# Altium project FRED_MIERING.PrjPCB (part 1 of 2)
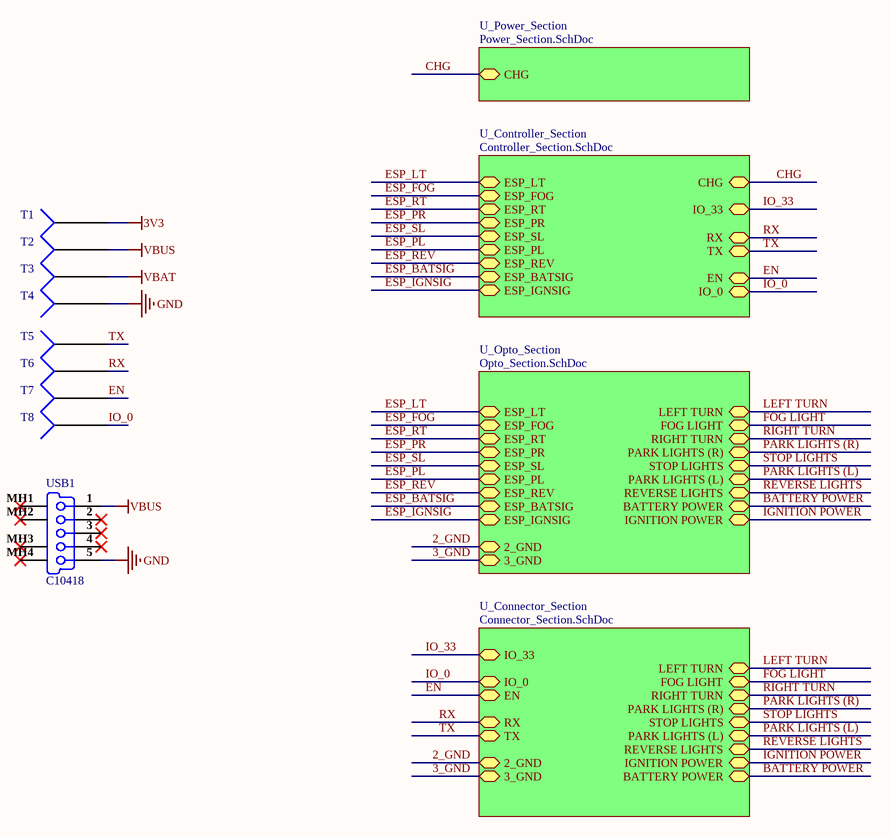
[diagram p0: Top_Sheet.SchDoc]
5 sheets, 105 parts. Net scope: hierarchical (ports join the sheet entries above them; power ports are global).
Board file: Fred_ New.PcbDoc
Sheets:
  Top_Sheet.SchDoc
    U_Power_Section = Power_Section.SchDoc
    U_Controller_Section = Controller_Section.SchDoc
    U_Opto_Section = Opto_Section.SchDoc
    U_Connector_Section = Connector_Section.SchDoc

## Sheet Top_Sheet.SchDoc
size A4; DocumentNumber: 1; SheetNumber: 1; SheetTotal: 5

### Parts
T1  Socket  [Socket]  (value not drawn)
T2  Socket  [Socket]  (value not drawn)
T3  Socket  [Socket]  (value not drawn)
T4  Socket  [Socket]  (value not drawn)
T5  Socket  [Socket]  (value not drawn)
T6  Socket  [Socket]  (value not drawn)
T7  Socket  [Socket]  (value not drawn)
T8  Socket  [Socket]  (value not drawn)
USB1  C10418  [C10418]

### Sub-sheets
U_Connector_Section = Connector_Section.SchDoc: IO_33 (bidir), RX (bidir), TX (bidir), IO_0 (bidir), EN (bidir), 3_GND (bidir), 2_GND (bidir), BATTERY POWER (bidir), REVERSE LIGHTS (bidir), IGNITION POWER (bidir), PARK LIGHTS (L) (bidir), STOP LIGHTS (bidir), PARK LIGHTS (R) (bidir), RIGHT TURN (bidir), FOG LIGHT (bidir), LEFT TURN (bidir)
U_Controller_Section = Controller_Section.SchDoc: CHG (bidir), IO_33 (bidir), RX (bidir), TX (bidir), EN (bidir), IO_0 (bidir), ESP_REV (bidir), ESP_PL (bidir), ESP_BATSIG (bidir), ESP_SL (bidir), ESP_PR (bidir), ESP_RT (bidir), ESP_IGNSIG (bidir), ESP_FOG (bidir), ESP_LT (bidir)
U_Opto_Section = Opto_Section.SchDoc: 3_GND (bidir), 2_GND (bidir), LEFT TURN (bidir), PARK LIGHTS (L) (bidir), REVERSE LIGHTS (bidir), STOP LIGHTS (bidir), BATTERY POWER (bidir), IGNITION POWER (bidir), PARK LIGHTS (R) (bidir), FOG LIGHT (bidir), RIGHT TURN (bidir), ESP_PL (bidir), ESP_LT (bidir), ESP_RT (bidir), ESP_BATSIG (bidir), ESP_SL (bidir), ESP_REV (bidir), ESP_IGNSIG (bidir), ESP_FOG (bidir), ESP_PR (bidir)
U_Power_Section = Power_Section.SchDoc: CHG (bidir)

### Nets
3V3: T1.1
GND: T4.1 USB1.5(GND)
VBAT: T3.1
VBUS: T2.1 USB1.1(V_BUS_(5V))
2_GND: sheet U_Opto_Section/2_GND, sheet U_Connector_Section/2_GND
3_GND: sheet U_Opto_Section/3_GND, sheet U_Connector_Section/3_GND
BATTERY POWER: sheet U_Opto_Section/BATTERY POWER, sheet U_Connector_Section/BATTERY POWER
CHG: sheet U_Power_Section/CHG, sheet U_Controller_Section/CHG
EN: T7.1 ; sheet U_Controller_Section/EN, sheet U_Connector_Section/EN
ESP_BATSIG: sheet U_Controller_Section/ESP_BATSIG, sheet U_Opto_Section/ESP_BATSIG
ESP_FOG: sheet U_Controller_Section/ESP_FOG, sheet U_Opto_Section/ESP_FOG
ESP_IGNSIG: sheet U_Controller_Section/ESP_IGNSIG, sheet U_Opto_Section/ESP_IGNSIG
ESP_LT: sheet U_Controller_Section/ESP_LT, sheet U_Opto_Section/ESP_LT
ESP_PL: sheet U_Controller_Section/ESP_PL, sheet U_Opto_Section/ESP_PL
ESP_PR: sheet U_Controller_Section/ESP_PR, sheet U_Opto_Section/ESP_PR
ESP_REV: sheet U_Controller_Section/ESP_REV, sheet U_Opto_Section/ESP_REV
ESP_RT: sheet U_Controller_Section/ESP_RT, sheet U_Opto_Section/ESP_RT
ESP_SL: sheet U_Controller_Section/ESP_SL, sheet U_Opto_Section/ESP_SL
FOG LIGHT: sheet U_Opto_Section/FOG LIGHT, sheet U_Connector_Section/FOG LIGHT
IGNITION POWER: sheet U_Opto_Section/IGNITION POWER, sheet U_Connector_Section/IGNITION POWER
IO_0: T8.1 ; sheet U_Controller_Section/IO_0, sheet U_Connector_Section/IO_0
IO_33: sheet U_Controller_Section/IO_33, sheet U_Connector_Section/IO_33
LEFT TURN: sheet U_Opto_Section/LEFT TURN, sheet U_Connector_Section/LEFT TURN
PARK LIGHTS (L): sheet U_Opto_Section/PARK LIGHTS (L), sheet U_Connector_Section/PARK LIGHTS (L)
PARK LIGHTS (R): sheet U_Opto_Section/PARK LIGHTS (R), sheet U_Connector_Section/PARK LIGHTS (R)
REVERSE LIGHTS: sheet U_Opto_Section/REVERSE LIGHTS, sheet U_Connector_Section/REVERSE LIGHTS
RIGHT TURN: sheet U_Opto_Section/RIGHT TURN, sheet U_Connector_Section/RIGHT TURN
RX: T6.1 ; sheet U_Controller_Section/RX, sheet U_Connector_Section/RX
STOP LIGHTS: sheet U_Opto_Section/STOP LIGHTS, sheet U_Connector_Section/STOP LIGHTS
TX: T5.1 ; sheet U_Controller_Section/TX, sheet U_Connector_Section/TX

Not connected (* = marked no-connect by the designer): USB1 2(D-)* 3(D+)* 4(NC)* MH1(Tab)* MH2(Tab)* MH3(Tab)* MH4(Tab)*

### Library data of the parts
USB1 = C10418: USB - Micro B Female USB 2 5 SMD USB Connectors RoHS; Manufacturer: Jing Extension of the Electronic Co.; Gender: Receptacle; Connector Type: USB,Receptacle; Number of Contacts: 5; Number of Ports: 1; Manufacturer Part Number: C10418; Mount: Surface Mount,Horizontal; Number of Terminals: 5; Termination: Solder; Orientation: Right Angle; ComponentLink1URL: http://www.amphenol-icc.com/media/wysiwyg/files/drawing/10118194.pdf?src-supplier=Digi-Key; ComponentLink1Description: http://www.amphenol-icc.com/media/wysiwyg/files/drawing/10118194.pdf?src-supplier=Digi-Key; ComponentLink2URL: https://cdn.amphenol-icc.com/media/wysiwyg/files/drawing/10118194.pdf?src-supplier=Mouser; ComponentLink2Description: https://cdn.amphenol-icc.com/media/wysiwyg/files/drawing/10118194.pdf?src-supplier=Mouser; ComponentLink3URL: https://cdn.amphenol-icc.com/media/wysiwyg/files/drawing/10118194.pdf?src-supplier=Verical; ComponentLink3Description: https://cdn.amphenol-icc.com/media/wysiwyg/files/drawing/10118194.pdf?src-supplier=Verical; Link: https://lcsc.com/product-detail/USB-Connectors_Jing-Extension-of-the-Electronic-Co-C10418_C10418.html
T1-T8 = Socket: LatestRevisionDate: 17-Jul-2002; LatestRevisionNote: Re-released for DXP Platform.; Publisher: Altium Limited

## Sheet Power_Section.SchDoc: Power Section
size A4; Engineer: Electron Ali; DocumentNumber: 2; SheetNumber: 2; SheetTotal: 5
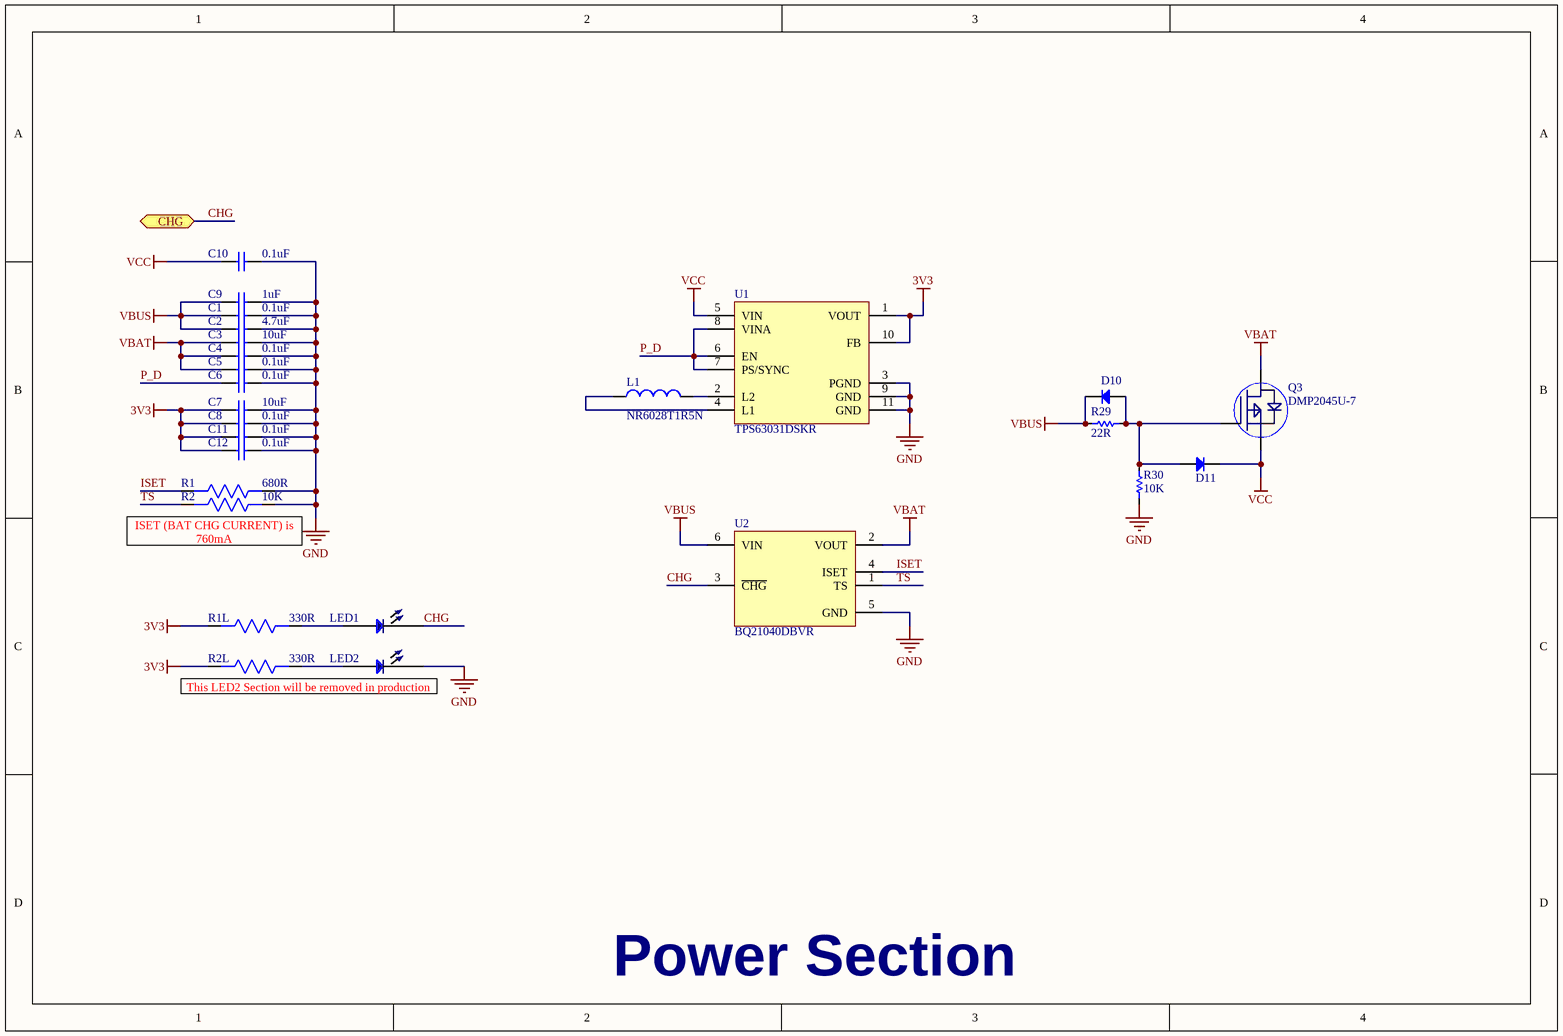
[diagram p1: Power_Section.SchDoc]

### Parts
C1  0.1uF  [Cap0603]
C2  4.7uF  [Cap0603]
C3  10uF  [Cap0603]
C4  0.1uF  [Cap0603]
C5  0.1uF  [Cap0603]
C6  0.1uF  [Cap0603]
C7  10uF  [Cap0603]
C8  0.1uF  [Cap0603]
C9  1uF  [Cap0603]
C10  0.1uF  [Cap0603]
C11  0.1uF  [Cap0603]
C12  0.1uF  [Cap0603]
D10  1N4148W-7-F  [SOD-123]  (value not drawn)
D11  1N4148W-7-F  [SOD-123]  (value not drawn)
L1  NR6028T1R5N  [NR6028T1R5N]
LED1  APT1608QBC/D  [LED 0603]  (value not drawn)
LED2  APT1608QBC/D  [LED 0603]  (value not drawn)
Q3  DMP2045U-7  [SOT23-3]
R1  680R  [Res0603]
R1L  330R  [Res0603]
R2  10K  [Res0603]
R2L  330R  [Res0603]
R29  22R  [Res-0603]
R30  10K  [Res-0603]
U1  TPS63031DSKR  [TPS63031DSKR]
U2  BQ21040DBVR  [BQ21040DBVR]

### Ports
CHG (bidir)

### Nets
3V3: C7.1 C8.1 C11.1 C12.1 R1L.2 R2L.2 U1.1(VOUT) U1.10(FB)
GND: C1.2 C2.2 C3.2 C4.2 C5.2 C6.2 C7.2 C8.2 C9.2 C10.2 C11.2 C12.2 LED2.2 R1.1 R2.1 R30.1 U1.3(PGND) U1.9(GND) U1.11(GND) U2.5(GND)
VBAT: C3.1 C4.1 C5.1 Q3.3(D) U2.2(VOUT)
VBUS: C1.1 C2.1 C9.1 D10.2(K) R29.1 U2.6(VIN)
VCC: C10.1 D11.2(K) Q3.2(S) U1.5(VIN)
CHG: LED1.2 U2.3(~{CHG}) ; port CHG
ISET: R1.2 U2.4(ISET)
P_D: C6.1 U1.6(EN) U1.7(PS/SYNC) U1.8(VINA)
TS: R2.2 U2.1(TS)
NetD10_1: D10.1(A) D11.1(A) Q3.1(G) R29.2 R30.2
NetL1_1: L1.1 U1.4(L1)
NetL1_2: L1.2 U1.2(L2)
NetLED1_1: LED1.1 R1L.1
NetLED2_1: LED2.1 R2L.1

### Notes on the sheet
- (near R2) ISET (BAT CHG CURRENT) is 760mA
- This LED2 Section will be removed in production
- Power Section

### Library data of the parts
C1 C4-C6 C8 C10-C12 = CC0603ZRY5V9BB104: CAP CER 0.1UF 50V Y5V 0603; Manufacturer: Yageo; Capacitance: 100nF; Tolerance: 80%; Supplier 1: Digi-Key; Manufacturer Part Number: CC0603ZRY5V9BB104; Stock 1: 15000880; Pricing 1: 1=0.1, 10=0.075, 100=0.0334, 500=0.02386, 1000=0.01874 (USD); Mount: Surface Mount; Case/Package: 0603; Number of Pins: 2; Case Code (Metric): 1608; Case Code (Imperial): 0603; Min Operating Temperature: -30°C; Max Operating Temperature: 85°C; Dielectric: Y5V; Voltage Rating: 50V; Package Quantity: 1; Packaging: Tape and Reel; Voltage Rating (DC): 50V; Termination: SMD/SMT; Composition: Ceramic; Voltage: 50V; Length: 1.6mm; Height: 0.8mm; Width: 0.031inch; Thickness: 0.035inch; Depth: 0.8mm; Radiation Hardening: No; REACH SVHC: No SVHC; Lead Free: Lead Free; Halogen Free: Halogen Free; ComponentLink1URL: http://www.yageo.com/documents/recent/UPY-GPHC_Y5V_6.3V-to-50V_8.pdf?src-supplier=Digi-Key; ComponentLink1Description: http://www.yageo.com/documents/recent/UPY-GPHC_Y5V_6.3V-to-50V_8.pdf?src-supplier=Digi-Key; ComponentLink2URL: http://www.yageo.com/documents/recent/UPY-GPHC_Y5V_6.3V-to-50V_5.pdf?src-supplier=Avnet+Europe; ComponentLink2Description: http://www.yageo.com/documents/recent/UPY-GPHC_Y5V_6.3V-to-50V_5.pdf?src-supplier=Avnet+Europe; ComponentLink3URL: https://www.verical.com/server-webapp/html/getDatasheet?partID=403611&src-supplier=Verical; ComponentLink3Description: https://www.verical.com/server-webapp/html/getDatasheet?partID=403611&src-supplier=Verical; ComponentLink4URL: http://www.mouser.com/ds/2/447/Yageo_UPY-GP_NP0_16V-to-50V_9-358835.pdf?src-supplier=Mouser; ComponentLink4Description: http://www.mouser.com/ds/2/447/Yageo_UPY-GP_NP0_16V-to-50V_9-358835.pdf?src-supplier=Mouser; ComponentLink5URL: http://www.farnell.com/datasheets/1132289.pdf?src-supplier=Element14; ComponentLink5Description: http://www.farnell.com/datasheets/1132289.pdf?src-supplier=Element14; Supplier Part Number 1: 311-1343-1-ND
C2 = GRM188R61E475KE11D: CAP CER 4.7UF 25V X5R 0603; Manufacturer: Murata; Material: Ceramic; Tolerance: 10%; Supplier 1: Digi-Key; Manufacturer Part Number: GRM188R61E475KE11D; Stock 1: 71618; Pricing 1: 1=0.37, 10=0.258, 100=0.1549, 500=0.1162, 1000=0.09812 (USD); Mount: Surface Mount; Case/Package: 0603; Case Code (Metric): 1608; Case Code (Imperial): 0603; Min Operating Temperature: -55°C; Max Operating Temperature: 85°C; Package Quantity: 4000; Packaging: Cut Tape; Capacitance: 4.7uF; Voltage Rating: 25V; Dielectric: X5R; Voltage: 25V; Voltage Rating (DC): 25V; Length: 1.6mm; Height: 0.8mm; Width: 0.031inch; Thickness: 0.031inch; Depth: 0.8mm; REACH SVHC: No SVHC; Lead Free: Lead Free; ComponentLink1URL: http://www.farnell.com/datasheets/2048165.pdf?src-supplier=Element14; ComponentLink1Description: http://www.farnell.com/datasheets/2048165.pdf?src-supplier=Element14; ComponentLink2URL: https://www.murata.com/~/media/webrenewal/support/library/catalog/products/capacitor/mlcc/c02e.ashx?la=en-us&src-supplier=Digi-Key; ComponentLink2Description: https://www.murata.com/~/media/webrenewal/support/library/catalog/products/capacitor/mlcc/c02e.ashx?la=en-us&src-supplier=Digi-Key; Supplier Part Number 1: 490-7203-1-ND
C3 C7 = C1608X5R1E106M080AC: CAP CER 10UF 25V X5R 0603; Manufacturer: TDK; Dielectric Material: Ceramic; Tolerance: 20%; Supplier 1: Digi-Key; Manufacturer Part Number: C1608X5R1E106M080AC; Stock 1: 61681; Pricing 1: 1=0.96, 10=0.704, 100=0.483, 500=0.38238, 1000=0.322 (USD); Mount: Surface Mount; Case/Package: 0603; Weight: 7.1E-05oz; Case Code (Imperial): 0603; Case Code (Metric): 1608; Min Operating Temperature: -55°C; Max Operating Temperature: 85°C; Capacitance: 10uF; Packaging: Tape and Reel; Voltage Rating: 25V; Voltage Rating (DC): 25V; Termination: SMD/SMT; Package Quantity: 1; Dielectric: X5R; Composition: Ceramic; Length: 1.6mm; Height: 0.8mm; Width: 0.8mm; Thickness: 0.039inch; Depth: 0.8mm; Lead Free: Lead Free; REACH SVHC: No SVHC; Supplier Part Number 1: 445-9015-1-ND
C9 = UMK107AB7105KA-T: CAP CER 1UF 50V X7R 0603; Manufacturer: Taiyo Yuden; Tolerance: 10%; ComponentLink1URL: http://www.farnell.com/datasheets/2048165.pdf?src-supplier=Element14; ComponentLink1Description: http://www.farnell.com/datasheets/2048165.pdf?src-supplier=Element14; ComponentLink2URL: https://www.murata.com/~/media/webrenewal/support/library/catalog/products/capacitor/mlcc/c02e.ashx?la=en-us&src-supplier=Digi-Key; ComponentLink2Description: https://www.murata.com/~/media/webrenewal/support/library/catalog/products/capacitor/mlcc/c02e.ashx?la=en-us&src-supplier=Digi-Key; Supplier 1: Digi-Key; Manufacturer Part Number: UMK107AB7105KA-T; Stock 1: 453098; Pricing 1: 1=0.28, 10=0.19, 100=0.1079, 500=0.0762, 1000=0.0667 (USD); Mount: Surface Mount; Case/Package: 0603; Case Code (Metric): 1608; Case Code (Imperial): 0603; Min Operating Temperature: -55°C; Max Operating Temperature: 125°C; Packaging: Tape and Reel; Package Quantity: 1; Capacitance: 1uF; Voltage Rating: 50V; Voltage Rating (DC): 50V; Dielectric: X7R; Termination: SMD/SMT; Length: 1.6mm; Height: 0.8mm; Width: 0.031inch; Thickness: 0.037inch; Depth: 0.8mm; Radiation Hardening: No; Halogen Free: Halogen Free; ComponentLink3URL: https://www.yuden.co.jp/productdata/catalog/mlcc_all_e.pdf?src-supplier=Digi-Key; ComponentLink3Description: https://www.yuden.co.jp/productdata/catalog/mlcc_all_e.pdf?src-supplier=Digi-Key; ComponentLink4URL: https://www.yuden.co.jp/productdata/catalog/mlcc_all_e.pdf?src-supplier=Onlinecomponents.com; ComponentLink4Description: https://www.yuden.co.jp/productdata/catalog/mlcc_all_e.pdf?src-supplier=Onlinecomponents.com; Supplier Part Number 1: 587-3247-1-ND
D10 D11 = 1N4148W-7-F: DIODE GEN PURP 100V 300MA SOD123; Manufacturer: Diodes; Forward Current: 150mA; Reverse Recovery Time: 4ns; Max Forward Surge Current (Ifsm): 2A; Element Configuration: Single; Max Reverse Current: 1uA; Forward Voltage: 1.25V; Power Dissipation: 400mW; Polarity: Standard; Voltage Rating (DC): 75V; Value: 2pF; Supplier 1: Future Electronics; Manufacturer Part Number: 1N4148W-7-F; RoHS: Yes; Category: Rectifier Diodes; Stock 1: 32931000; Pricing 1: 3000=0.01840, 12000=0.01760, 45000=0.01690, 120000=0.01640, 300000=0.01560 (USD); Mounting Technology: Surface Mount; Pins: 2; Weight: 0.000353oz; Contact Plating: Tin,Matte; Min Operating Temperature: -65°C; Max Operating Temperature: 150°C; Packaging: Tape and Reel; Max Repetitive Reverse Voltage (Vrrm): 100V; Peak Non-Repetitive Surge Current: 2A; Voltage: 100V; Max Surge Current: 2A; Package Quantity: 3000; Recovery Time: 4ns; Average Rectified Current: 300mA; Power Rating: 400mW; Current Rating: 150mA; Output Current: 150mA; Max Reverse Voltage (DC): 100V; Series: -; Reverse Recovery Time-Max: 4ns; Length: 2.85mm; Width: 1.7mm; Height: 1.25mm; Radiation Hardening: No; RoHS Compliant: Yes; Reach SVHC Compliant: Yes; Lead Free: Lead Free; ComponentLink1URL: https://datasheet.ciiva.com/1179/1915529-1179304.pdf?src-supplier=Element14; ComponentLink1Description: https://datasheet.ciiva.com/1179/1915529-1179304.pdf?src-supplier=Element14; ComponentLink2URL: https://datasheet.ciiva.com/22695/1915529-22695239.pdf?src-supplier=Element14; ComponentLink2Description: https://datasheet.ciiva.com/22695/1915529-22695239.pdf?src-supplier=Element14; ComponentLink3URL: https://datasheet.ciiva.com/8300/ds30086-8300392.pdf?src-supplier=Avnet; ComponentLink3Description: https://datasheet.ciiva.com/8300/ds30086-8300392.pdf?src-supplier=Avnet; ComponentLink4URL: https://datasheet.ciiva.com/15219/getdatasheetpartid-110030-15219548.pdf?src-supplier=Verical; ComponentLink4Description: https://datasheet.ciiva.com/15219/getdatasheetpartid-110030-15219548.pdf?src-supplier=Verical; ComponentLink5URL: https://datasheet.ciiva.com/8303/ds30086-8303197.pdf?src-supplier=Avnet; ComponentLink5Description: https://datasheet.ciiva.com/8303/ds30086-8303197.pdf?src-supplier=Avnet; ComponentLink6URL: https://datasheet.ciiva.com/911/ds30086-911735.pdf?src-supplier=Digi-Key; ComponentLink6Description: https://datasheet.ciiva.com/911/ds30086-911735.pdf?src-supplier=Digi-Key; ComponentLink7URL: https://datasheet.ciiva.com/911/ds30086-911736.pdf?src-supplier=Digi-Key; ComponentLink7Description: https://datasheet.ciiva.com/911/ds30086-911736.pdf?src-supplier=Digi-Key; ComponentLink8URL: https://datasheet.ciiva.com/911/ds30086-911734.pdf?src-supplier=Digi-Key; ComponentLink8Description: https://datasheet.ciiva.com/911/ds30086-911734.pdf?src-supplier=Digi-Key; ComponentLink9URL: https://datasheet.ciiva.com/4435/ds30086-4435128.pdf?src-supplier=Mouser; ComponentLink9Description: https://datasheet.ciiva.com/4435/ds30086-4435128.pdf?src-supplier=Mouser; Supplier Part Number 1: 7634694; LCSC Part Number: C83528; Item Type: Diode
L1 = NR6028T1R5N: FIXED IND 1.5UH 4.2A 20.8 MOHM; Manufacturer: Taiyo Yuden; Manufacturer Part Number: NR6028T470M; Core Material: Ferrite; Tolerance: 20%; Current Rating: 920mA; Saturation Current: 950mA; Shielding: Shielded; Self Resonant Frequency: 8MHz; Inductance: 47uh; DC Resistance (DCR): 390mR; Test Frequency: 100kHz; Supplier 1: Digi-Key; Stock 1: 42241; Pricing 1: 1=0.36, 10=0.317, 100=0.2182, 500=0.18648, 1000=0.14283 (USD); Mount: Surface Mount; Case/Package: 2424; Number of Pins: 2; Min Operating Temperature: -25°C; Max Operating Temperature: 120°C; Packaging: Tape and Reel; Package Quantity: 2000; Inductance Tolerance: 20%; Composition: Wirewound; Max DC Current: 920mA; Termination: SMD/SMT; RMS Current (Irms): 920mA; Length: 0.236inch; Height: 2.8mm; Width: 0.236inch; Height - Seated (Max): 0.11inch; REACH SVHC: Unknown; Halogen Free: Halogen Free; ComponentLink1URL: https://www.yuden.co.jp/productdata/catalog/wound04_e.pdf?src-supplier=Avnet; ComponentLink1Description: https://www.yuden.co.jp/productdata/catalog/wound04_e.pdf?src-supplier=Avnet; ComponentLink2URL: https://www.yuden.co.jp/productdata/catalog/wound04_e.pdf?src-supplier=Digi-Key; ComponentLink2Description: https://www.yuden.co.jp/productdata/catalog/wound04_e.pdf?src-supplier=Digi-Key; ComponentLink3URL: https://www.yuden.co.jp/productdata/catalog/wound04_e.pdf?src-supplier=Onlinecomponents.com; ComponentLink3Description: https://www.yuden.co.jp/productdata/catalog/wound04_e.pdf?src-supplier=Onlinecomponents.com; ComponentLink4URL: https://www.yuden.co.jp/productdata/catalog/wound04_e.pdf?src-supplier=Mouser; ComponentLink4Description: https://www.yuden.co.jp/productdata/catalog/wound04_e.pdf?src-supplier=Mouser; Supplier Part Number 1: 587-2104-1-ND
LED1 LED2 = APT1608QBC/D: LED BLUE CLEAR CHIP SMD; Manufacturer: Kingbright; Lens Color: Clear,Colorless; Luminous Intensity: 100mcd; Viewing Angle: 120°; Lens Style: Clear,Flat; Forward Current: 20mA; Forward Voltage: 3.3V; Dominant Wavelength: 465nm; Number of LEDs: 1; Supplier 1: Digi-Key; Manufacturer Part Number: APT1608QBC/D; Stock 1: 106851; Pricing 1: 1=0.49, 10=0.35, 25=0.286, 100=0.2288, 250=0.19304, 500=0.16446, 1000=0.1287 (USD); Mount: Surface Mount; Case/Package: 0603; Number of Pins: 2; Color: Blue; Case Code (Metric): 1608; Case Code (Imperial): 0603; Min Operating Temperature: -40°C; Max Operating Temperature: 85°C; Package Quantity: 2000; Packaging: Tape and Reel; Illumination Color: Blue; Lens Transparency: Clear; Test Current: 20mA; Length: 1.6mm; Height: 0.75mm; Width: 0.8mm; Lead Free: Lead Free; ComponentLink1URL: http://www.kingbrightusa.com/images/catalog/SPEC/APT1608QBC-D.pdf?src-supplier=Digi-Key; ComponentLink1Description: http://www.kingbrightusa.com/images/catalog/SPEC/APT1608QBC-D.pdf?src-supplier=Digi-Key; ComponentLink2URL: http://www.mouser.com/ds/2/216/APT1608QBC-D-65281.pdf?src-supplier=Mouser; ComponentLink2Description: http://www.mouser.com/ds/2/216/APT1608QBC-D-65281.pdf?src-supplier=Mouser; Supplier Part Number 1: 754-1434-1-ND
Q3 = DMP2045U-7: MOSFET P-CHAN 24V SOT23
R1 = RC0603FR-07680RL: RES SMD 680 OHM 1% 1/10W 0603; Manufacturer: Yageo; Temperature Coefficient: 100ppm/°C; Voltage Rating (DC): 50V; Power Rating: 100mW; Supplier 1: Digi-Key; Manufacturer Part Number: RC0603FR-07680RL; Stock 1: 4278227; Pricing 1: 1=0.1, 10=0.024, 100=0.0097, 1000=0.00437, 2500=0.00379 (USD); Case/Package: 0603; Number of Pins: 2; Case Code (Imperial): 0603; Case Code (Metric): 1608; Min Operating Temperature: -55°C; Max Operating Temperature: 155°C; Resistance: 680R; Tolerance: 1%; Composition: Thick Film; Packaging: Tape and Reel; Number of Terminations: 2; Military Standard: Not; Voltage Rating: 50V; Package Quantity: 1; Termination: SMD/SMT; Max Power Dissipation: 100mW; Features: Moisture Resistant; Length: 1.6mm; Height: 0.022inch; Width: 0.031inch; Depth: 0.8mm; REACH SVHC: No SVHC; Lead Free: Lead Free; ComponentLink1URL: http://www.farnell.com/datasheets/1868787.pdf?src-supplier=Element14; ComponentLink1Description: http://www.farnell.com/datasheets/1868787.pdf?src-supplier=Element14; ComponentLink2URL: http://documents.rs-components.com/techlib://itc_doclist_GB.htm?stockno=5048221&src-supplier=RSComponents; ComponentLink2Description: http://documents.rs-components.com/techlib://itc_doclist_GB.htm?stockno=5048221&src-supplier=RSComponents; ComponentLink3URL: http://www.farnell.com/datasheets/443971.pdf?src-supplier=Element14; ComponentLink3Description: http://www.farnell.com/datasheets/443971.pdf?src-supplier=Element14; ComponentLink4URL: http://www.yageo.com/documents/recent/PYu-RC_Group_51_RoHS_L_10.pdf?src-supplier=Digi-Key; ComponentLink4Description: http://www.yageo.com/documents/recent/PYu-RC_Group_51_RoHS_L_10.pdf?src-supplier=Digi-Key; Supplier Part Number 1: 311-680HRCT-ND
R1L R2L = RC0603FR-07330RL: RES SMD 330 OHM 1% 1/10W 0603; Manufacturer: Yageo; Temperature Coefficient: 100ppm/°C; Voltage Rating (DC): 50V; Power Rating: 100mW; Supplier 1: Digi-Key; Manufacturer Part Number: RC0603FR-07330RL; Stock 1: 9084897; Pricing 1: 1=0.1, 10=0.024, 100=0.0097, 1000=0.00437, 2500=0.00379 (USD); Case/Package: 0603; Number of Pins: 2; Case Code (Metric): 1608; Case Code (Imperial): 0603; Min Operating Temperature: -55°C; Max Operating Temperature: 155°C; Resistance: 330R; Tolerance: 1%; Composition: Thick Film; Packaging: Tape and Reel; Voltage Rating: 50V; Package Quantity: 1; Number of Terminations: 2; Termination: SMD/SMT; Max Power Dissipation: 100mW; Features: Moisture Resistant; Length: 1.6mm; Height: 0.45mm; Width: 0.8mm; Depth: 0.8mm; REACH SVHC: No SVHC; Lead Free: Lead Free; ComponentLink1URL: http://www.yageo.com/documents/recent/PYu-RC_Group_51_RoHS_L_10.pdf?src-supplier=Digi-Key; ComponentLink1Description: http://www.yageo.com/documents/recent/PYu-RC_Group_51_RoHS_L_10.pdf?src-supplier=Digi-Key; ComponentLink2URL: http://www.farnell.com/datasheets/2167052.pdf?src-supplier=Mouser; ComponentLink2Description: http://www.farnell.com/datasheets/2167052.pdf?src-supplier=Mouser; ComponentLink3URL: http://www.farnell.com/datasheets/1868787.pdf?src-supplier=Element14; ComponentLink3Description: http://www.farnell.com/datasheets/1868787.pdf?src-supplier=Element14; ComponentLink4URL: http://www.farnell.com/datasheets/443971.pdf?src-supplier=Element14; ComponentLink4Description: http://www.farnell.com/datasheets/443971.pdf?src-supplier=Element14; ComponentLink5URL: http://www.farnell.com/datasheets/1686128.pdf?src-supplier=Element14; ComponentLink5Description: http://www.farnell.com/datasheets/1686128.pdf?src-supplier=Element14; ComponentLink6URL: http://documents.rs-components.com/techlib://itc_doclist_GB.htm?stockno=5046499&src-supplier=RSComponents; ComponentLink6Description: http://documents.rs-components.com/techlib://itc_doclist_GB.htm?stockno=5046499&src-supplier=RSComponents; Supplier Part Number 1: 311-330HRCT-ND
R2 = RC0603FR-0710KL: RES SMD 10K OHM 1% 1/10W 0603; Manufacturer: Yageo; Resistance: 10kR; Temperature Coefficient: 100ppm/°C; Voltage Rating (DC): 50V; Power Rating: 100mW; Voltage Rating: 75V; Supplier 1: Digi-Key; Manufacturer Part Number: RC0603FR-0710KL; Stock 1: 144725424; Pricing 1: 1=0.1, 10=0.024, 100=0.0097, 1000=0.00437, 2500=0.00379 (USD); Case/Package: 0603; Number of Pins: 2; Weight: 7.1E-05oz; Case Code (Imperial): 0603; Case Code (Metric): 1608; Min Operating Temperature: -55°C; Max Operating Temperature: 155°C; Tolerance: 1%; Composition: Thick Film; Packaging: Tape and Reel; Military Standard: Not; Termination: SMD/SMT; Length: 1.6mm; Height: 0.45mm; Width: 0.8mm; Depth: 0.8mm; Lead Pitch: 0.3mm; REACH SVHC: No SVHC; Lead Free: Lead Free; ComponentLink1URL: http://www.farnell.com/datasheets/38590.pdf?src-supplier=Element14; ComponentLink1Description: http://www.farnell.com/datasheets/38590.pdf?src-supplier=Element14; ComponentLink2URL: https://www.verical.com/server-webapp/html/getDatasheet?partID=409289&src-supplier=Verical; ComponentLink2Description: https://www.verical.com/server-webapp/html/getDatasheet?partID=409289&src-supplier=Verical; ComponentLink3URL: http://www.farnell.com/datasheets/1868787.pdf?src-supplier=Element14; ComponentLink3Description: http://www.farnell.com/datasheets/1868787.pdf?src-supplier=Element14; ComponentLink4URL: http://www.farnell.com/datasheets/2167052.pdf?src-supplier=Element14; ComponentLink4Description: http://www.farnell.com/datasheets/2167052.pdf?src-supplier=Element14; ComponentLink5URL: http://www.farnell.com/datasheets/443971.pdf?src-supplier=Element14; ComponentLink5Description: http://www.farnell.com/datasheets/443971.pdf?src-supplier=Element14; Supplier Part Number 1: 311-10.0KHRDKR-ND
R29 = RC0603FR-0722RL: RES 22 OHM 1% 1/10W 0603; Manufacturer: Yageo; Temperature Coefficient: 100ppm/°C; Voltage Rating (DC): 50V; Power Rating: 100mW; Item Type: Resistor; Supplier 1: Avnet; Manufacturer Part Number: RC0603FR-0722RL; RoHS: Yes; Category: Chip SMD Resistors; Stock 1: 190000; Pricing 1: 5000=0.00133, 10000=0.00131, 20000=0.00127 (USD); Case/Package: 0603; Number of Pins: 2; Case Code (Metric): 1608; Case Code (Imperial): 0603; Size Code: 0603; Min Operating Temperature: -55°C; Max Operating Temperature: 155°C; Tolerance: 1%; Resistance: 22R; Resistor Type: Thick Film; Packaging: Tape and Reel; Voltage Rating: 50V; Package Quantity: 1; Number of Terminations: 2; Termination: SMD/SMT; Max Power Dissipation: 100mW; Features: Moisture Resistant; Series: RC; Resistance Tolerance: 1%; Technology: THICK FILM; Construction: Rectangular; Length: 0.063inch; Width: 0.031inch; Height: 0.022inch; Depth: 0.8mm; Reach SVHC Compliant: Yes; Lead Free: Lead Free; Military Standard: Not; RoHS Compliant: Yes; ComponentLink1URL: https://datasheet.ciiva.com/11819/0900766b80f96399-11819285.pdf?src-supplier=RSComponents; ComponentLink1Description: https://datasheet.ciiva.com/11819/0900766b80f96399-11819285.pdf?src-supplier=RSComponents; ComponentLink2URL: https://datasheet.ciiva.com/46395/443971-46395032.pdf?src-supplier=Element14; ComponentLink2Description: https://datasheet.ciiva.com/46395/443971-46395032.pdf?src-supplier=Element14; ComponentLink3URL: https://datasheet.ciiva.com/46440/1868787-46440901.pdf?src-supplier=Element14; ComponentLink3Description: https://datasheet.ciiva.com/46440/1868787-46440901.pdf?src-supplier=Element14; ComponentLink4URL: https://datasheet.ciiva.com/2454/pyu-r-int-thick-7-2454355.pdf?src-supplier=Digi-Key; ComponentLink4Description: https://datasheet.ciiva.com/2454/pyu-r-int-thick-7-2454355.pdf?src-supplier=Digi-Key; ComponentLink5URL: https://datasheet.ciiva.com/2454/pyu-r-int-thick-7-2454356.pdf?src-supplier=Digi-Key; ComponentLink5Description: https://datasheet.ciiva.com/2454/pyu-r-int-thick-7-2454356.pdf?src-supplier=Digi-Key; ComponentLink6URL: https://datasheet.ciiva.com/2454/pyu-r-int-thick-7-2454354.pdf?src-supplier=Digi-Key; ComponentLink6Description: https://datasheet.ciiva.com/2454/pyu-r-int-thick-7-2454354.pdf?src-supplier=Digi-Key; Supplier Part Number 1: RC0603FR-0722RL; LCSC Part Number: C107701
R30 = AC0603JR-0710KL: RES SMD 10K OHM 5% 1/10W 0603; Manufacturer: Yageo; Voltage Rating: 50V; Resistance: 10kR; Power Rating: 100mW; Temperature Coefficient: 100ppm/°C; Item Type: Resistor; Supplier 1: Future Electronics; Manufacturer Part Number: AC0603JR-0710KL; RoHS: Yes; Category: Chip SMD Resistors; Stock 1: 1533000; Pricing 1: 5000=0.00540 (USD); Case/Package: 0603; Case Code (Imperial): 0603; Case Code (Metric): 1608; Size Code: 0603; Min Operating Temperature: -55°C; Max Operating Temperature: 155°C; Packaging: Tape and Reel; Tolerance: 5%; Package Quantity: 1; Resistor Type: Thick Film; Termination: SMD/SMT; Number of Terminations: 2; Max Power Dissipation: 100mW; Features: Moisture Resistant,Automotive AEC-Q200,Anti-Sulfur; Series: AC; Construction: Rectangular; Length: 0.063inch; Width: 0.031inch; Height: 0.022inch; Depth: 0.8mm; Military Standard: Not; Lead Free: Lead Free; RoHS Compliant: Yes; ComponentLink1URL: https://datasheet.ciiva.com/5562/pyu-ac-51-rohs-l-2-5562553.pdf?src-supplier=Mouser; ComponentLink1Description: https://datasheet.ciiva.com/5562/pyu-ac-51-rohs-l-2-5562553.pdf?src-supplier=Mouser; Supplier Part Number 1: 1029044; LCSC Part Number: C140867
U1 = TPS63031DSKR: Conv DC-DC 1.8V to 5.5V Non-Inv/Inv/Step Up/Step Down Single-Out 3.3V 0.8A 10-Pin WSON; Manufacturer: Texas Instruments; Switching Frequency: 2.4MHz; Output Current: 800mA; Number of Outputs: 1; Synchronous Rectifier: Yes; Quiescent Current: 25uA; Output Type: Fixed; Efficiency: 96%; Topology: Buck-Boost; Output Configuration: Positive; ComponentLink1URL: http://www.ti.com/lit/ds/symlink/tps63001.pdf; ComponentLink1Description: http://www.ti.com/lit/ds/symlink/tps63001.pdf; ComponentLink2URL: http://focus.ti.com/lit/ds/symlink/tps63001.pdf; ComponentLink2Description: http://focus.ti.com/lit/ds/symlink/tps63001.pdf; ComponentLink3URL: http://www.ti.com/general/docs/lit/getliterature.tsp?genericPartNumber=TPS63002&&fileType=pdf; ComponentLink3Description: http://www.ti.com/general/docs/lit/getliterature.tsp?genericPartNumber=TPS63002&&fileType=pdf; Supplier 1: Arrow; Manufacturer Part Number: TPS63031DSKR; Stock 1: 0; Mount: Surface Mount; Number of Pins: 10; Contact Plating: Gold; Min Operating Temperature: -40°C; Max Operating Temperature: 85°C; Output Voltage: 3.3V; Min Input Voltage: 1.8V; Packaging: Tape and Reel; Package Quantity: 3000; Max Output Current: 800mA; Max Input Voltage: 5.5V; Operating Supply Voltage: 5.5V; Min Output Voltage: 3.3V; Nominal Output Voltage: 3.3V; Radiation Hardening: No; Lead Free: Lead Free; REACH SVHC: No SVHC; ComponentLink4URL: http://www.ti.com/general/docs/lit/getliterature.tsp?genericPartNumber=TPS63031&&fileType=pdf&src-supplier=Avnet; ComponentLink4Description: http://www.ti.com/general/docs/lit/getliterature.tsp?genericPartNumber=TPS63031&&fileType=pdf&src-supplier=Avnet; ComponentLink5URL: http://www.ti.com/lit/ds/symlink/tps63030.pdf?src-supplier=Digi-Key; ComponentLink5Description: http://www.ti.com/lit/ds/symlink/tps63030.pdf?src-supplier=Digi-Key; Supplier Part Number 1: TPS63031DSKR**MULT1
U2 = BQ21040DBVR: IC BAT CHG LI-ION 1 CELL SOT23-6; Manufacturer: Texas Instruments; Number of Cells: 1; Supplier 1: Digi-Key; Manufacturer Part Number: BQ21040DBVR; Stock 1: 10857; Pricing 1: 1=1.14, 10=1.015, 100=0.7912, 500=0.65364, 1000=0.51603 (USD); Lead Free: Lead Free; Supplier Part Number 1: 296-47315-1-ND

## Sheet Controller_Section.SchDoc
size A4; DocumentNumber: 3; SheetNumber: 3; SheetTotal: 5
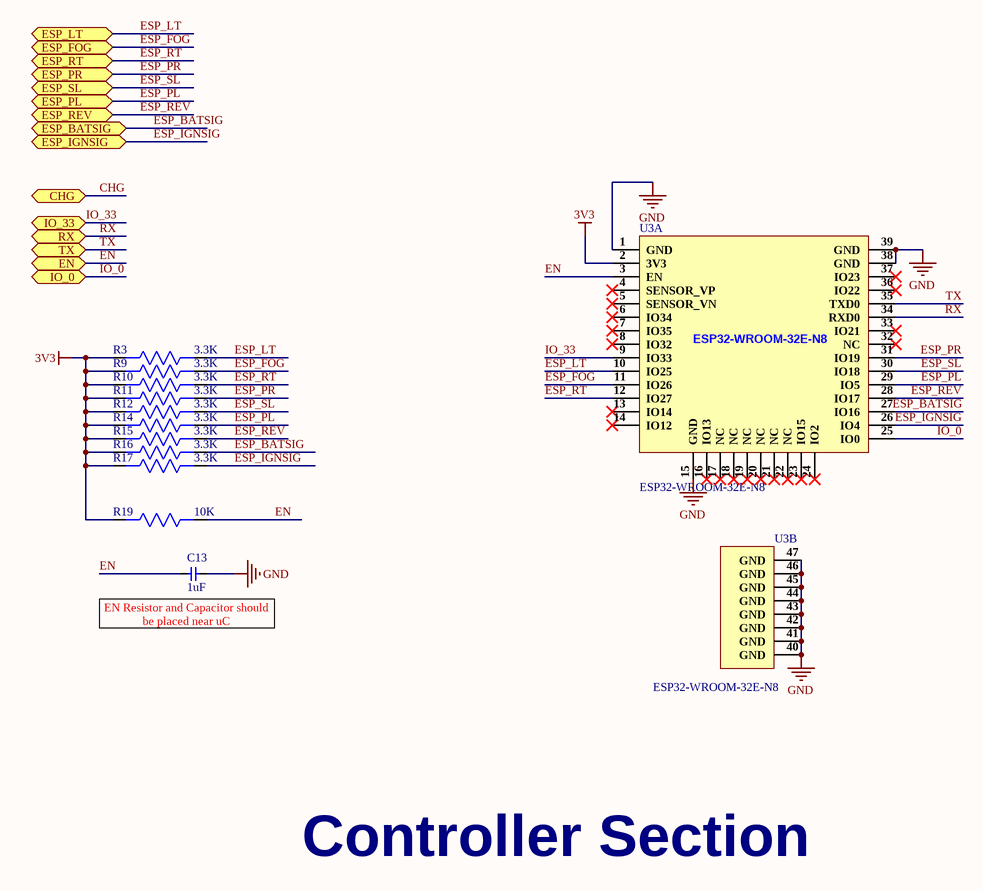
[diagram p2: Controller_Section.SchDoc]

### Parts
C13  1uF  [Cap-0603]
R3  3.3K  [Res0603]
R9  3.3K  [Res0603]
R10  3.3K  [Res0603]
R11  3.3K  [Res0603]
R12  3.3K  [Res0603]
R14  3.3K  [Res0603]
R15  3.3K  [Res0603]
R16  3.3K  [Res0603]
R17  3.3K  [Res0603]
R19  10K  [Resistor0805]
U3  ESP32-WROOM-32E-N8  [38-SMD Module]  (parts A,B of 2)

### Ports
CHG (bidir), EN (bidir), ESP_BATSIG (bidir), ESP_FOG (bidir), ESP_IGNSIG (bidir), ESP_LT (bidir), ESP_PL (bidir), ESP_PR (bidir), ESP_REV (bidir), ESP_RT (bidir), ESP_SL (bidir), IO_0 (bidir), IO_33 (bidir), RX (bidir), TX (bidir)

### Nets
3V3: R3.2 R9.2 R10.2 R11.2 R12.2 R14.2 R15.2 R16.2 R17.2 R19.2 U3.2(3V3)
GND: C13.2 U3.1(GND) U3.15(GND) U3.38(GND) U3.39(GND) U3.40(GND) U3.41(GND) U3.42(GND) U3.43(GND) U3.44(GND) U3.45(GND) U3.46(GND) U3.47(GND)
EN: C13.1 R19.1 U3.3(EN) ; port EN
ESP_BATSIG: R16.1 U3.27(IO16) ; port ESP_BATSIG
ESP_FOG: R9.1 U3.11(IO26) ; port ESP_FOG
ESP_IGNSIG: R17.1 U3.26(IO4) ; port ESP_IGNSIG
ESP_LT: R3.1 U3.10(IO25) ; port ESP_LT
ESP_PL: R14.1 U3.29(IO5) ; port ESP_PL
ESP_PR: R11.1 U3.31(IO19) ; port ESP_PR
ESP_REV: R15.1 U3.28(IO17) ; port ESP_REV
ESP_RT: R10.1 U3.12(IO27) ; port ESP_RT
ESP_SL: R12.1 U3.30(IO18) ; port ESP_SL
IO_0: U3.25(IO0) ; port IO_0
IO_33: U3.9(IO33) ; port IO_33
RX: U3.34(RXD0) ; port RX
TX: U3.35(TXD0) ; port TX

Not connected (* = marked no-connect by the designer): U3 4(SENSOR_VP)* 5(SENSOR_VN)* 6(IO34)* 7(IO35)* 8(IO32)* 13(IO14)* 14(IO12)* 16(IO13)* 17(NC)* 18(NC)* 19(NC)* 20(NC)* 21(NC)* 22(NC)* 23(IO15)* 24(IO2)* 32(NC)* 33(IO21)* 36(IO22)* 37(IO23)*

### Notes on the sheet
- (near C13) EN Resistor and Capacitor should be placed near uC
- Controller Section

### Library data of the parts
C13 = CC0603KRX5R6BB105: CAP CER 1UF 10V X5R 0603; Manufacturer: Yageo; Tolerance: 10%; Item Type: Capacitor; Supplier 1: Avnet; Manufacturer Part Number: CC0603KRX5R6BB105; RoHS: Yes; Category: Ceramic Capacitors; Stock 1: 88000; Pricing 1: 4000=0.01005, 8000=0.00977, 16000=0.00949, 24000=0.00922, 32000=0.00894 (USD); Mount: Surface Mount; Case/Package: 0603; Number of Pins: 2; Case Code (Imperial): 0603; Case Code (Metric): 1608; Min Operating Temperature: -55°C; Max Operating Temperature: 85°C; Capacitance: 1uF; Dielectric: X5R; Voltage Rating: 10V; Voltage Rating (DC): 10V; Packaging: Tape and Reel; Package Quantity: 4000; Termination: SMD/SMT; Resistor Type: Ceramic; Voltage: 10V; Series: CC; Length: 1.6mm; Width: 0.031inch; Height: 0.8mm; Thickness: 0.035inch; Depth: 0.8mm; Radiation Hardening: No; Reach SVHC Compliant: Yes; Lead Free: Lead Free; Halogen Free: Halogen Free; RoHS Compliant: Yes; ComponentLink1URL: https://datasheet.ciiva.com/176/mlccorderingcode-176685.pdf?src-supplier=Digi-Key; ComponentLink1Description: https://datasheet.ciiva.com/176/mlccorderingcode-176685.pdf?src-supplier=Digi-Key; ComponentLink2URL: https://datasheet.ciiva.com/176/mlccorderingcode-176684.pdf?src-supplier=Digi-Key; ComponentLink2Description: https://datasheet.ciiva.com/176/mlccorderingcode-176684.pdf?src-supplier=Digi-Key; ComponentLink3URL: https://datasheet.ciiva.com/176/mlccorderingcode-176686.pdf?src-supplier=Digi-Key; ComponentLink3Description: https://datasheet.ciiva.com/176/mlccorderingcode-176686.pdf?src-supplier=Digi-Key; ComponentLink4URL: https://datasheet.ciiva.com/11587/upy-gphc-x5r-4v-to-50v-12-11587194.pdf?src-supplier=Avnet; ComponentLink4Description: https://datasheet.ciiva.com/11587/upy-gphc-x5r-4v-to-50v-12-11587194.pdf?src-supplier=Avnet; Supplier Part Number 1: CC0603KRX5R6BB105; LCSC Part Number: C106214
R3 R9-R12 R14-R17 = RC0603FR-073K3L: RES SMD 3.3K OHM 1% 1/10W 0603; Manufacturer: Yageo Phycomp; Temperature Coefficient: 100ppm/°C; Resistance: 3.3kR; Voltage Rating (DC): 50V; Power Rating: 100mW; Supplier 1: Digi-Key; Manufacturer Part Number: RC0603FR-073K3L; Stock 1: 6863000; Pricing 1: 1=0.1, 10=0.024, 100=0.0097, 1000=0.00437, 2500=0.00379 (USD); Mount: Surface Mount; Case/Package: 0603; Number of Pins: 2; Min Operating Temperature: -55°C; Max Operating Temperature: 155°C; Tolerance: 1%; Packaging: Cut Tape; Length: 1.6mm; Height: 0.45mm; Width: 800um; Depth: 0.8mm; REACH SVHC: No SVHC; Lead Free: Lead Free; Supplier Part Number 1: 311-3.30KHRCT-ND
R19 = RT0805BRB0710KL: RES SMD 10K OHM 0.1% 1/8W 0805; Manufacturer: Yageo; Resistance: 10kR; Temperature Coefficient: 10ppm/°C; Power Rating: 125mW; Voltage Rating: 150V; Supplier 1: Digi-Key; Manufacturer Part Number: RT0805BRB0710KL; Stock 1: 13114; Pricing 1: 1=0.73, 10=0.606, 100=0.4071, 1000=0.23925 (USD); Case/Package: 0805; Weight: 0.000194oz; Contact Plating: Tin,Matte; Case Code (Imperial): 0805; Case Code (Metric): 2012; Min Operating Temperature: -55°C; Max Operating Temperature: 125°C; Tolerance: 0.1%; Composition: Thin Film; Packaging: Tape and Reel; Package Quantity: 1; Termination: SMD/SMT; Number of Terminations: 2; Military Standard: Not; Max Power Dissipation: 125mW; Features: Moisture Resistant; Length: 2mm; Height: 0.024inch; Width: 1.25mm; Depth: 1.25mm; Radiation Hardening: No; ComponentLink1URL: http://www.yageo.com/documents/recent/PYu-RT_1-to-0.05_RoHS_L_6.pdf?src-supplier=Avnet; ComponentLink1Description: http://www.yageo.com/documents/recent/PYu-RT_1-to-0.05_RoHS_L_6.pdf?src-supplier=Avnet; Supplier Part Number 1: 311-10KNFCT-ND
U3 = ESP32-WROOM-32E-N8: SMD,18x25.5mm WiFi Modules ROHS; Manufacturer: Espressif Systems; Item Type: Module; Supplier 1: Mouser; Manufacturer Part Number: ESP32-WROOM-32E-N8; RoHS: No; Category: Uncategorized; Stock 1: 24616; Pricing 1: 1=3.30000, 10=3.30000, 50=3.30000, 100=3.30000, 1000=3.30000, 10000=3.30000 (USD); Supplier Part Number 1: 356-ESP32WRM32E164PH; LCSC Part Number: C701342; ComponentLink1Description: LCSC; ComponentLink1URL: https://www.lcsc.com/product-detail/WiFi-Modules_Espressif-Systems-ESP32-WROOM-32E-N8_C701342.html

## Sheet Opto_Section.SchDoc
size A4; DocumentNumber: 4; SheetNumber: 4; SheetTotal: 5
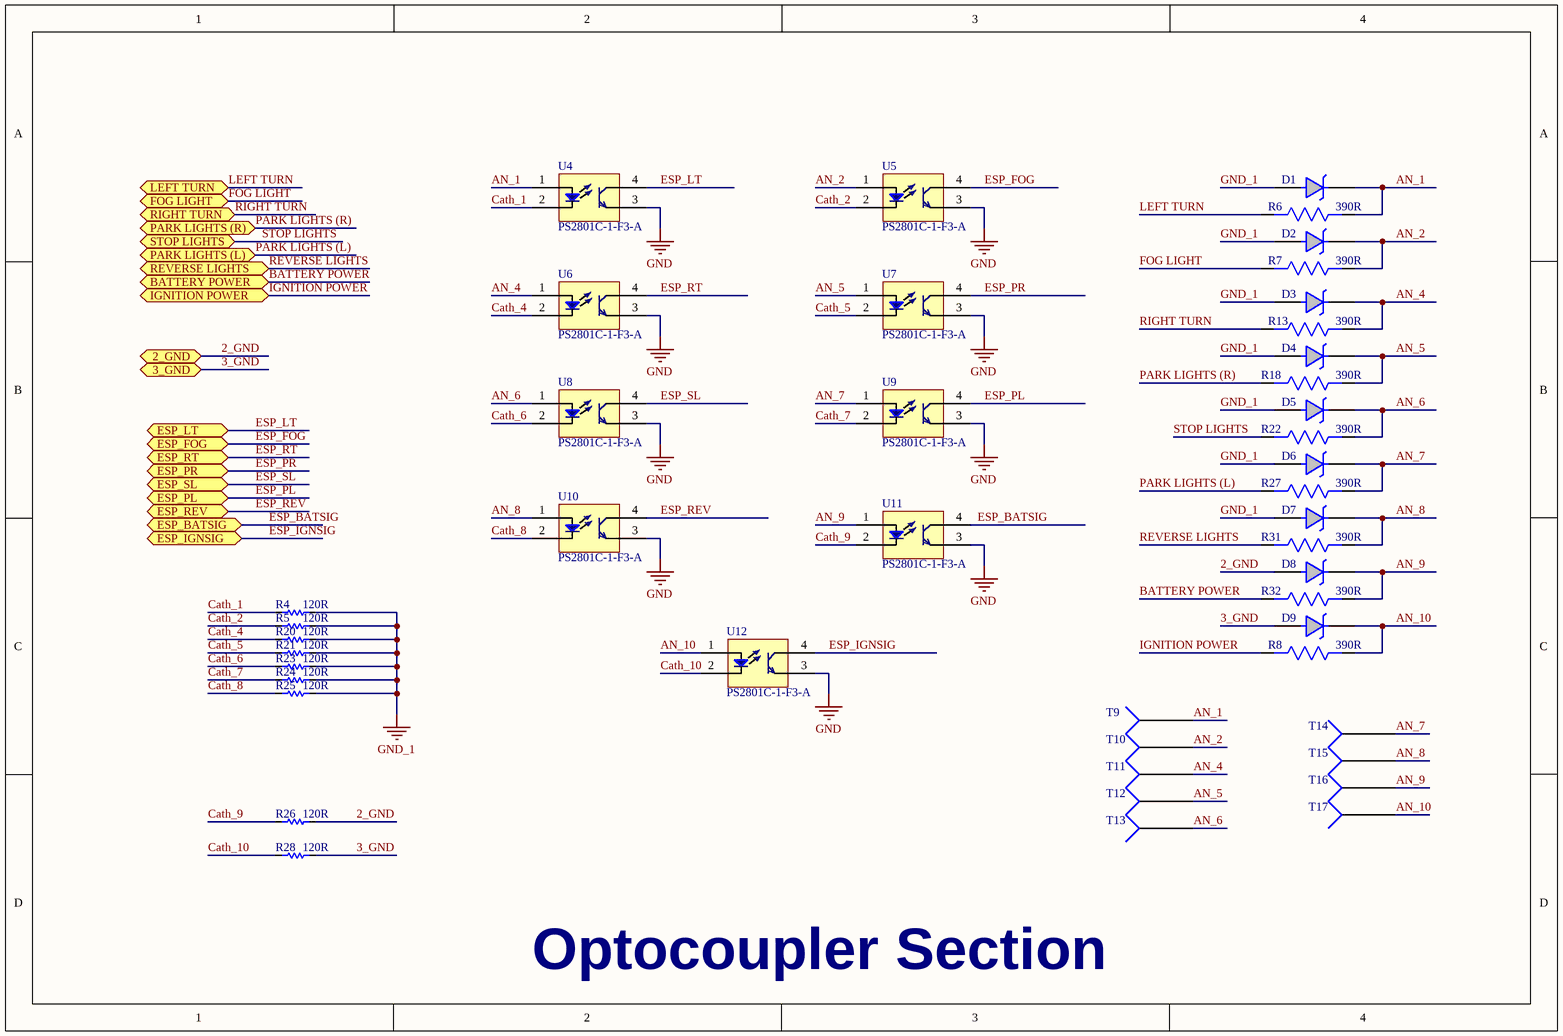
[diagram p3: Opto_Section.SchDoc]

### Parts
D1  MM3Z3V3B  [MM3Z3V3B]  (value not drawn)
D2  MM3Z3V3B  [MM3Z3V3B]  (value not drawn)
D3  MM3Z3V3B  [MM3Z3V3B]  (value not drawn)
D4  MM3Z3V3B  [MM3Z3V3B]  (value not drawn)
D5  MM3Z3V3B  [MM3Z3V3B]  (value not drawn)
D6  MM3Z3V3B  [MM3Z3V3B]  (value not drawn)
D7  MM3Z3V3B  [MM3Z3V3B]  (value not drawn)
D8  MM3Z3V3B  [MM3Z3V3B]  (value not drawn)
D9  MM3Z3V3B  [MM3Z3V3B]  (value not drawn)
R4  120R  [Res-0603]
R5  120R  [Res-0603]
R6  390R  [Res1218]
R7  390R  [Res1218]
R8  390R  [Res1218]
R13  390R  [Res1218]
R18  390R  [Res1218]
R20  120R  [Res-0603]
R21  120R  [Res-0603]
R22  390R  [Res1218]
R23  120R  [Res-0603]
R24  120R  [Res-0603]
R25  120R  [Res-0603]
R26  120R  [Res-0603]
R27  390R  [Res1218]
R28  120R  [Res-0603]
R31  390R  [Res1218]
R32  390R  [Res1218]
T9  Socket  [Socket]  (value not drawn)
T10  Socket  [Socket]  (value not drawn)
T11  Socket  [Socket]  (value not drawn)
T12  Socket  [Socket]  (value not drawn)
T13  Socket  [Socket]  (value not drawn)
T14  Socket  [Socket]  (value not drawn)
T15  Socket  [Socket]  (value not drawn)
T16  Socket  [Socket]  (value not drawn)
T17  Socket  [Socket]  (value not drawn)
U4  PS2801C-1-F3-A  [PS2801C-1-F3-A]
U5  PS2801C-1-F3-A  [PS2801C-1-F3-A]
U6  PS2801C-1-F3-A  [PS2801C-1-F3-A]
U7  PS2801C-1-F3-A  [PS2801C-1-F3-A]
U8  PS2801C-1-F3-A  [PS2801C-1-F3-A]
U9  PS2801C-1-F3-A  [PS2801C-1-F3-A]
U10  PS2801C-1-F3-A  [PS2801C-1-F3-A]
U11  PS2801C-1-F3-A  [PS2801C-1-F3-A]
U12  PS2801C-1-F3-A  [PS2801C-1-F3-A]

### Ports
2_GND (bidir), 3_GND (bidir), BATTERY POWER (bidir), ESP_BATSIG (bidir), ESP_FOG (bidir), ESP_IGNSIG (bidir), ESP_LT (bidir), ESP_PL (bidir), ESP_PR (bidir), ESP_REV (bidir), ESP_RT (bidir), ESP_SL (bidir), FOG LIGHT (bidir), IGNITION POWER (bidir), LEFT TURN (bidir), PARK LIGHTS (L) (bidir), PARK LIGHTS (R) (bidir), REVERSE LIGHTS (bidir), RIGHT TURN (bidir), STOP LIGHTS (bidir)

### Nets
GND: U4.3(E) U5.3(E) U6.3(E) U7.3(E) U8.3(E) U9.3(E) U10.3(E) U11.3(E) U12.3(E)
GND_1: D1.1(ANODE) D2.1(ANODE) D3.1(ANODE) D4.1(ANODE) D5.1(ANODE) D6.1(ANODE) D7.1(ANODE) R4.2 R5.2 R20.2 R21.2 R23.2 R24.2 R25.2
2_GND: D8.1(ANODE) R26.2 ; port 2_GND
3_GND: D9.1(ANODE) R28.2 ; port 3_GND
AN_1: D1.2(CATHODE) R6.1 T9.1 U4.1(An)
AN_2: D2.2(CATHODE) R7.1 T10.1 U5.1(An)
AN_4: D3.2(CATHODE) R13.1 T11.1 U6.1(An)
AN_5: D4.2(CATHODE) R18.1 T12.1 U7.1(An)
AN_6: D5.2(CATHODE) R22.1 T13.1 U8.1(An)
AN_7: D6.2(CATHODE) R27.1 T14.1 U9.1(An)
AN_8: D7.2(CATHODE) R31.1 T15.1 U10.1(An)
AN_9: D8.2(CATHODE) R32.1 T16.1 U11.1(An)
AN_10: D9.2(CATHODE) R8.1 T17.1 U12.1(An)
BATTERY POWER: R32.2 ; port BATTERY POWER
Cath_1: R4.1 U4.2(Ca)
Cath_2: R5.1 U5.2(Ca)
Cath_4: R20.1 U6.2(Ca)
Cath_5: R21.1 U7.2(Ca)
Cath_6: R23.1 U8.2(Ca)
Cath_7: R24.1 U9.2(Ca)
Cath_8: R25.1 U10.2(Ca)
Cath_9: R26.1 U11.2(Ca)
Cath_10: R28.1 U12.2(Ca)
ESP_BATSIG: U11.4(C) ; port ESP_BATSIG
ESP_FOG: U5.4(C) ; port ESP_FOG
ESP_IGNSIG: U12.4(C) ; port ESP_IGNSIG
ESP_LT: U4.4(C) ; port ESP_LT
ESP_PL: U9.4(C) ; port ESP_PL
ESP_PR: U7.4(C) ; port ESP_PR
ESP_REV: U10.4(C) ; port ESP_REV
ESP_RT: U6.4(C) ; port ESP_RT
ESP_SL: U8.4(C) ; port ESP_SL
FOG LIGHT: R7.2 ; port FOG LIGHT
IGNITION POWER: R8.2 ; port IGNITION POWER
LEFT TURN: R6.2 ; port LEFT TURN
PARK LIGHTS (L): R27.2 ; port PARK LIGHTS (L)
PARK LIGHTS (R): R18.2 ; port PARK LIGHTS (R)
REVERSE LIGHTS: R31.2 ; port REVERSE LIGHTS
RIGHT TURN: R13.2 ; port RIGHT TURN
STOP LIGHTS: R22.2 ; port STOP LIGHTS

### Notes on the sheet
- Optocoupler Section

### Library data of the parts
D1-D9 = MM3Z3V3B: DIODE ZENER 3.3V 200MW SOD323F; Manufacturer: ON Semiconductor / Fairchild; Forward Voltage: 1V; Tolerance: 2%; Impedance: 89R; Max Reverse Leakage Current: 4.5uA; Test Current: 5mA; Element Configuration: Single; Supplier 1: Digi-Key; Manufacturer Part Number: MM3Z3V3B; Stock 1: 473644; Pricing 1: 1=0.22, 10=0.18, 100=0.0956, 500=0.06288, 1000=0.04276 (USD); Mount: Surface Mount; Number of Pins: 2; Weight: 0.0276g; Min Operating Temperature: -65°C; Max Operating Temperature: 150°C; Packaging: Tape and Reel; Package Quantity: 1; Max Power Dissipation: 200mW; Zener Voltage: 3.3V; Voltage Tolerance: 2%; Power Dissipation: 200mW; Working Voltage: 3.3V; Peak Reverse Current: 4.5uA; Length: 1.3mm; Height: 1mm; Width: 1.7mm; Radiation Hardening: No; REACH SVHC: No SVHC; Lead Free: Lead Free; ComponentLink1URL: http://www.onsemi.com/pub/Collateral/MM3Z9V1B-D.pdf?src-supplier=Digi-Key; ComponentLink1Description: http://www.onsemi.com/pub/Collateral/MM3Z9V1B-D.pdf?src-supplier=Digi-Key; ComponentLink2URL: http://www.mouser.com/ds/2/149/MM3Z3V3B-187166.pdf?src-supplier=Mouser; ComponentLink2Description: http://www.mouser.com/ds/2/149/MM3Z3V3B-187166.pdf?src-supplier=Mouser; ComponentLink3URL: https://www.fairchildsemi.com/datasheets/MM/MM3Z9V1B.pdf?src-supplier=Avnet; ComponentLink3Description: https://www.fairchildsemi.com/datasheets/MM/MM3Z9V1B.pdf?src-supplier=Avnet; ComponentLink4URL: http://www.farnell.com/datasheets/1706525.pdf?src-supplier=Element14; ComponentLink4Description: http://www.farnell.com/datasheets/1706525.pdf?src-supplier=Element14; Supplier Part Number 1: MM3Z3V3BCT-ND
R4 R5 R20 R21 R23-R26 R28 = RC0603FR-07120RL: RES 120 OHM 1% 1/10W 0603; Manufacturer: Yageo; Temperature Coefficient: 100ppm/°C; Voltage Rating (DC): 50V; Power Rating: 100mW; Supplier 1: Digi-Key; Manufacturer Part Number: RC0603FR-07120RL; RoHS: Yes; Category: Chip SMD Resistors; Stock 1: 839061; Pricing 1: 1=0.10000, 10=0.02400, 100=0.00970, 1000=0.00436, 2500=0.00378 (USD); Case/Package: 0603; Number of Pins: 2; Case Code (Metric): 1608; Case Code (Imperial): 0603; Size Code: 0603; Min Operating Temperature: -55°C; Max Operating Temperature: 155°C; Resistance: 120R; Tolerance: 1%; Resistor Type: Thick Film; Packaging: Tape and Reel; Voltage Rating: 50V; Package Quantity: 1; Number of Terminations: 2; Termination: SMD/SMT; Max Power Dissipation: 100mW; Features: Moisture Resistant; Series: RC; Construction: Rectangular; Resistance Tolerance: 1%; Length: 1.6mm; Width: 0.031inch; Height: 0.022inch; Depth: 0.8mm; REACH SVHC: No SVHC; Lead Free: Lead Free; Military Standard: Not; RoHS Compliant: Yes; ComponentLink1URL: https://datasheet.ciiva.com/2553/pyu-r-int-thick-7-2553512.pdf?src-supplier=Digi-Key; ComponentLink1Description: https://datasheet.ciiva.com/2553/pyu-r-int-thick-7-2553512.pdf?src-supplier=Digi-Key; ComponentLink2URL: https://datasheet.ciiva.com/7746/443971-7746248.pdf?src-supplier=Element14; ComponentLink2Description: https://datasheet.ciiva.com/7746/443971-7746248.pdf?src-supplier=Element14; ComponentLink3URL: https://datasheet.ciiva.com/2553/pyu-r-int-thick-7-2553513.pdf?src-supplier=Digi-Key; ComponentLink3Description: https://datasheet.ciiva.com/2553/pyu-r-int-thick-7-2553513.pdf?src-supplier=Digi-Key; ComponentLink4URL: https://datasheet.ciiva.com/7746/443971-7746249.pdf?src-supplier=Element14; ComponentLink4Description: https://datasheet.ciiva.com/7746/443971-7746249.pdf?src-supplier=Element14; ComponentLink5URL: https://datasheet.ciiva.com/2553/pyu-r-int-thick-7-2553514.pdf?src-supplier=Digi-Key; ComponentLink5Description: https://datasheet.ciiva.com/2553/pyu-r-int-thick-7-2553514.pdf?src-supplier=Digi-Key; ComponentLink6URL: https://datasheet.ciiva.com/46395/443971-46395021.pdf?src-supplier=Element14; ComponentLink6Description: https://datasheet.ciiva.com/46395/443971-46395021.pdf?src-supplier=Element14; Supplier Part Number 1: 311-120HRCT-ND; LCSC Part Number: C114640
R6-R8 R13 R18 R22 R27 R31 R32 = CRW1218F390RE04Z: RES SMD 390 OHM ±1% 1W ±100ppm/℃ 1218 Chip Resistor; Manufacturer: Ever Ohms Tech; Case/Package: 1218; Resistance: 390R; Termination: SMD/SMT; ComponentLink1URL: http://www.yageo.com.tw/exep/pages/download/literatures/PYu-R_INT-thick_7.pdf?src-supplier=Digi-Key; ComponentLink1Description: http://www.yageo.com.tw/exep/pages/download/literatures/PYu-R_INT-thick_7.pdf?src-supplier=Digi-Key; ComponentLink2URL: http://www.yageo.com/documents/recent/PYu-RC_Group_51_RoHS_L_10.pdf?src-supplier=Digi-Key; ComponentLink2Description: http://www.yageo.com/documents/recent/PYu-RC_Group_51_RoHS_L_10.pdf?src-supplier=Digi-Key; ComponentLink3URL: http://www.yageo.com/documents/recent/PYu-RC_Group_51_RoHS_L_9.pdf?src-supplier=Digi-Key; ComponentLink3Description: http://www.yageo.com/documents/recent/PYu-RC_Group_51_RoHS_L_9.pdf?src-supplier=Digi-Key; ComponentLink4URL: http://www.farnell.com/datasheets/443971.pdf?src-supplier=Element14; ComponentLink4Description: http://www.farnell.com/datasheets/443971.pdf?src-supplier=Element14; Supplier: LCSC; Supplier Part No.: C175553; Manufacturer Part No.: CRW1218F390RE04Z; Link: https://lcsc.com/product-detail/Chip-Resistor-Surface-Mount_Ever-Ohms-Tech-CR1218F390RE04_C175553.html
U4-U12 = PS2801C-1-F3-A: TransistorOptocouplers DC 1 2500Vrms SOP-4_P1.27 Optocouplers RoHS; Manufacturer: CEL; Number of Channels: 1; Collector Emitter Voltage (VCEO): 300mV; Forward Voltage: 1.2V; Max Power Dissipation: 120mW; Max Collector Current: 30mA; Max Output Voltage: 80V; Supplier 1: Digi-Key; Manufacturer Part Number: PS2801C-1-F3-A; Stock 1: 399; Pricing 1: 1=0.77, 10=0.595, 100=0.3825 (USD); Mount: Surface Mount; Case/Package: SOIC; Number of Pins: 4; Min Operating Temperature: -55°C; Max Operating Temperature: 100°C; Packaging: Tape and Reel; Collector Emitter Saturation Voltage: 300mV; Package Quantity: 1; Output Current per Channel: 30mA; Lead Free: Lead Free; ComponentLink1URL: http://www.cel.com/pdf/datasheets/PS2801C-1,PS2801C-4.pdf?src-supplier=Digi-Key; ComponentLink1Description: http://www.cel.com/pdf/datasheets/PS2801C-1,PS2801C-4.pdf?src-supplier=Digi-Key; ComponentLink2URL: http://www.cel.com/pdf/datasheets/how_to_order_optos.pdf?src-supplier=Digi-Key; ComponentLink2Description: http://www.cel.com/pdf/datasheets/how_to_order_optos.pdf?src-supplier=Digi-Key; ComponentLink3URL: http://datasheet.iiic.cc/cel/PS2801C-1-F3-A.pdf?src-supplier=IIIC; ComponentLink3Description: http://datasheet.iiic.cc/cel/PS2801C-1-F3-A.pdf?src-supplier=IIIC; Supplier Part Number 1: PS2801C-1-F3-ACT-ND
T9-T17 = Socket: LatestRevisionDate: 17-Jul-2002; LatestRevisionNote: Re-released for DXP Platform.; Publisher: Altium Limited